# Altium schematic sheet NanoD1_Decoupling.SchDoc
size 420 x 297 mm; SheetNumber: 2; SheetTotal: 8
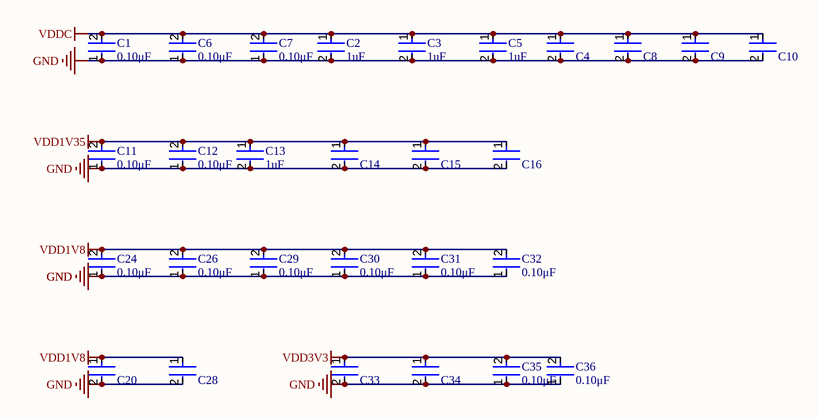
[diagram p0: NanoD1_Decoupling.SchDoc]

## Parts
C1  value 0.10μF  [FP-GRM15-MFG]  (hidden comment: 100nF)
C2  1uF  [FP-GRM15-0_1-IPC_B]
C3  1uF  [FP-GRM15-0_1-IPC_B]
C4  4.7uF  [FP-GRM155-0_15-MFG]  (value not drawn)
C5  1uF  [FP-GRM15-0_1-IPC_B]
C6  value 0.10μF  [FP-GRM15-MFG]  (hidden comment: 100nF)
C7  value 0.10μF  [FP-GRM15-MFG]  (hidden comment: 100nF)
C8  4.7uF  [FP-GRM155-0_15-MFG]  (value not drawn)
C9  10uF  [FP-GRM188-0_15-IPC_B]  (value not drawn)
C10  10uF  [FP-GRM188-0_15-IPC_B]  (value not drawn)
C11  value 0.10μF  [FP-GRM15-MFG]  (hidden comment: 100nF)
C12  value 0.10μF  [FP-GRM15-MFG]  (hidden comment: 100nF)
C13  1uF  [FP-GRM15-0_1-IPC_B]
C14  4.7uF  [FP-GRM155-0_15-MFG]  (value not drawn)
C15  4.7uF  [FP-GRM155-0_15-MFG]  (value not drawn)
C16  10uF  [FP-GRM188-0_15-IPC_B]  (value not drawn)
C20  10uF  [FP-GRM188-0_15-IPC_B]  (value not drawn)
C24  value 0.10μF  [FP-GRM15-MFG]  (hidden comment: 100nF)
C26  value 0.10μF  [FP-GRM15-MFG]  (hidden comment: 100nF)
C28  10uF  [FP-GRM188-0_15-IPC_B]  (value not drawn)
C29  value 0.10μF  [FP-GRM15-MFG]  (hidden comment: 100nF)
C30  value 0.10μF  [FP-GRM15-MFG]  (hidden comment: 100nF)
C31  value 0.10μF  [FP-GRM15-MFG]  (hidden comment: 100nF)
C32  value 0.10μF  [FP-GRM15-MFG]  (hidden comment: 100nF)
C33  10uF  [FP-GRM188-0_15-IPC_B]  (value not drawn)
C34  10uF  [FP-GRM188-0_15-IPC_B]  (value not drawn)
C35  value 0.10μF  [FP-GRM15-MFG]  (hidden comment: 100nF)
C36  value 0.10μF  [FP-GRM15-MFG]  (hidden comment: 100nF)

## Nets
GND: C1.1 C2.2 C3.2 C4.2 C5.2 C6.1 C7.1 C8.2 C9.2 C10.2 C11.1 C12.1 C13.2 C14.2 C15.2 C16.2 C20.2 C24.1 C26.1 C28.2 C29.1 C30.1 C31.1 C32.1 C33.2 C34.2 C35.1 C36.1
VDD1V8: C20.1 C24.2 C26.2 C28.1 C29.2 C30.2 C31.2 C32.2
VDD1V35: C11.2 C12.2 C13.1 C14.1 C15.1 C16.1
VDD3V3: C33.1 C34.1 C35.2 C36.2
VDDC: C1.2 C2.1 C3.1 C4.1 C5.1 C6.2 C7.2 C8.1 C9.1 C10.1

## Notes on the sheet
- THIS DOCUMENT AND THE DATA DISCLOSED HEREIN OR
- HEREWITH IS THE PROPERTY OF ALTIUM LIMITED AND MAY
- DWG NO:
- REVISION
- REV:
- DESCRIPTION
- DATE
- APPROVED
- BE FREELY DISTRIBUTED IN WHOLE. NO RIGHTS ARE
- RESERVED OR EXPRESS OR IMPLIED WARANTEE GIVEN.
- ENG:
- APPROVALS
- PROJECT
- DSN:
- CHK:
- REFERENCE DOCUMENTS
- PROJECT REVISION:
- TITLE
- DOCUMENT REVISION:
- DESIGN ITEM:
- BOM:
- FAB DWG:
- PCB DWG:
- ASSY DWG:
- SCALE:
- A3
- SIZE
- CAGE CODE
- FILE NAME
- DWG NO.
- SHEET
- OF
- REV

## Library data of the parts
C1 C6 C7 C11 C12 C24 C26 C29-C32 C35 C36 = CMP-2100-03641-2: CAP CER 0.1UF 16V X7R 0402; Manufacturer Part Number: GRM155R71C104KA88D; Manufacturer: Murata; Standoff Height: 0mm; Tolerance: 10%; Voltage Rating: 16Vdc; Material: Ceramic; RoHS: TRUE; Temperature Characteristic: X7R; Octopart: https://octopart.com/grm155r71c104ka88d-murata-196880; Digikey Description: CAP CER 0.1UF 16V X7R 0402; Device Class L3: Ceramic Capacitors; Height: 0.55mm; ComponentLink2Description: Datasheet; Temperature Range Low: -55°C; Ipc Land Pattern Name: CAPC10050X219; ComponentLink2URL: https://search.murata.co.jp/Ceramy/image/img/A01X/G101/ENG/GRM155R71H471KA01-01A.pdf; Device Class L1: Passive Components; Lead Free: yes; Category: Cap; Package: GRM15; Temperature: -55°C to +125°C; Device Class L2: Capacitors; Capacitance: 0.10μF; Temperature Range High: +125°C; Mouser Description: 0402 0.1 uF 16V ±10 % Tolerance X7R SMT Multilayer Ceramic Capacitor
C2 C3 C5 C13 = CMP-2008-04556-2: CAP CER 1UF 10V X5R 0402; Manufacturer Part Number: GRM155R61A105KE15D; Manufacturer: Murata; Material: Ceramic; Tolerance: 10%; Temperature Coefficient: 15%; Value: 1uF; Octopart: https://octopart.com/grm155r61a105ke15d-murata-197442; Lead Free: Yes; ComponentLink2Description: Datasheet; Temperature: -55°C to +85°C; Temperature Range High: +85°C; Height: 0.55mm; Capacitance: 1uF; Ipc Land Pattern Name: CAPC10050X50; ComponentLink2URL: https://search.murata.co.jp/Ceramy/image/img/A01X/G101/ENG/GRM155R61A105KE15-01A.pdf; Temperature Range Low: -55°C; Device Class L2: Capacitors; Voltage Rating: 10V; RoHS: TRUE; Device Class L1: Passive Components; Device Class L3: Ceramic Capacitors; Temperature Characteristic: X5R; Mouser Description: 0402 1 uF 10 V ±10% Tolerance X5R Surface Mount Multilayer Ceramic Capacitor; Automotive: No; Package: GRM15-0.1; Digikey Description: CAP CER 1UF 10V X5R 0402; Category: Cap
C4 C8 C14 C15 = CMP-06035-003573-1: Chip Multilayer Ceramic Capacitors for General Purpose, 0402, 4.7uF, X5R, 15%, 20%, 10V; Case/Package: 0402; Voltage Rating: 10V; Min Operating Temperature: -55°C; Mount: Surface Mount; Packaging: Tape and Reel; Max Operating Temperature: 85°C; Capacitance: 4.7uF; Case Code (Metric): 1005; Case Code (Imperial): 0402; Tolerance: 20%
C9 C10 C16 C20 C28 C33 C34 = CMP-06035-003612-1: Chip Multilayer Ceramic Capacitors for General Purpose, 0603, 10uF, X5R, 15%, 20%, 10V; Tolerance: 20%; Dielectric: X5R; Package Quantity: 4000; Width: 0.8mm; Case/Package: 0603; Thickness: 0.035inch; Capacitance: 10uF; Voltage Rating: 10V; Voltage Rating (DC): 10V; Termination: SMD/SMT; Length: 1.6mm; Lead Free: Lead Free; Mount: Surface Mount; Height: 0.8mm; Depth: 0.8mm; Packaging: Tape and Reel; Weight: 0.000222oz; Min Operating Temperature: -55°C; Case Code (Metric): 1608; Max Operating Temperature: 85°C; Case Code (Imperial): 0603; Material: Ceramic